# EAGLE board Airband (EAGLE 8.6.3)
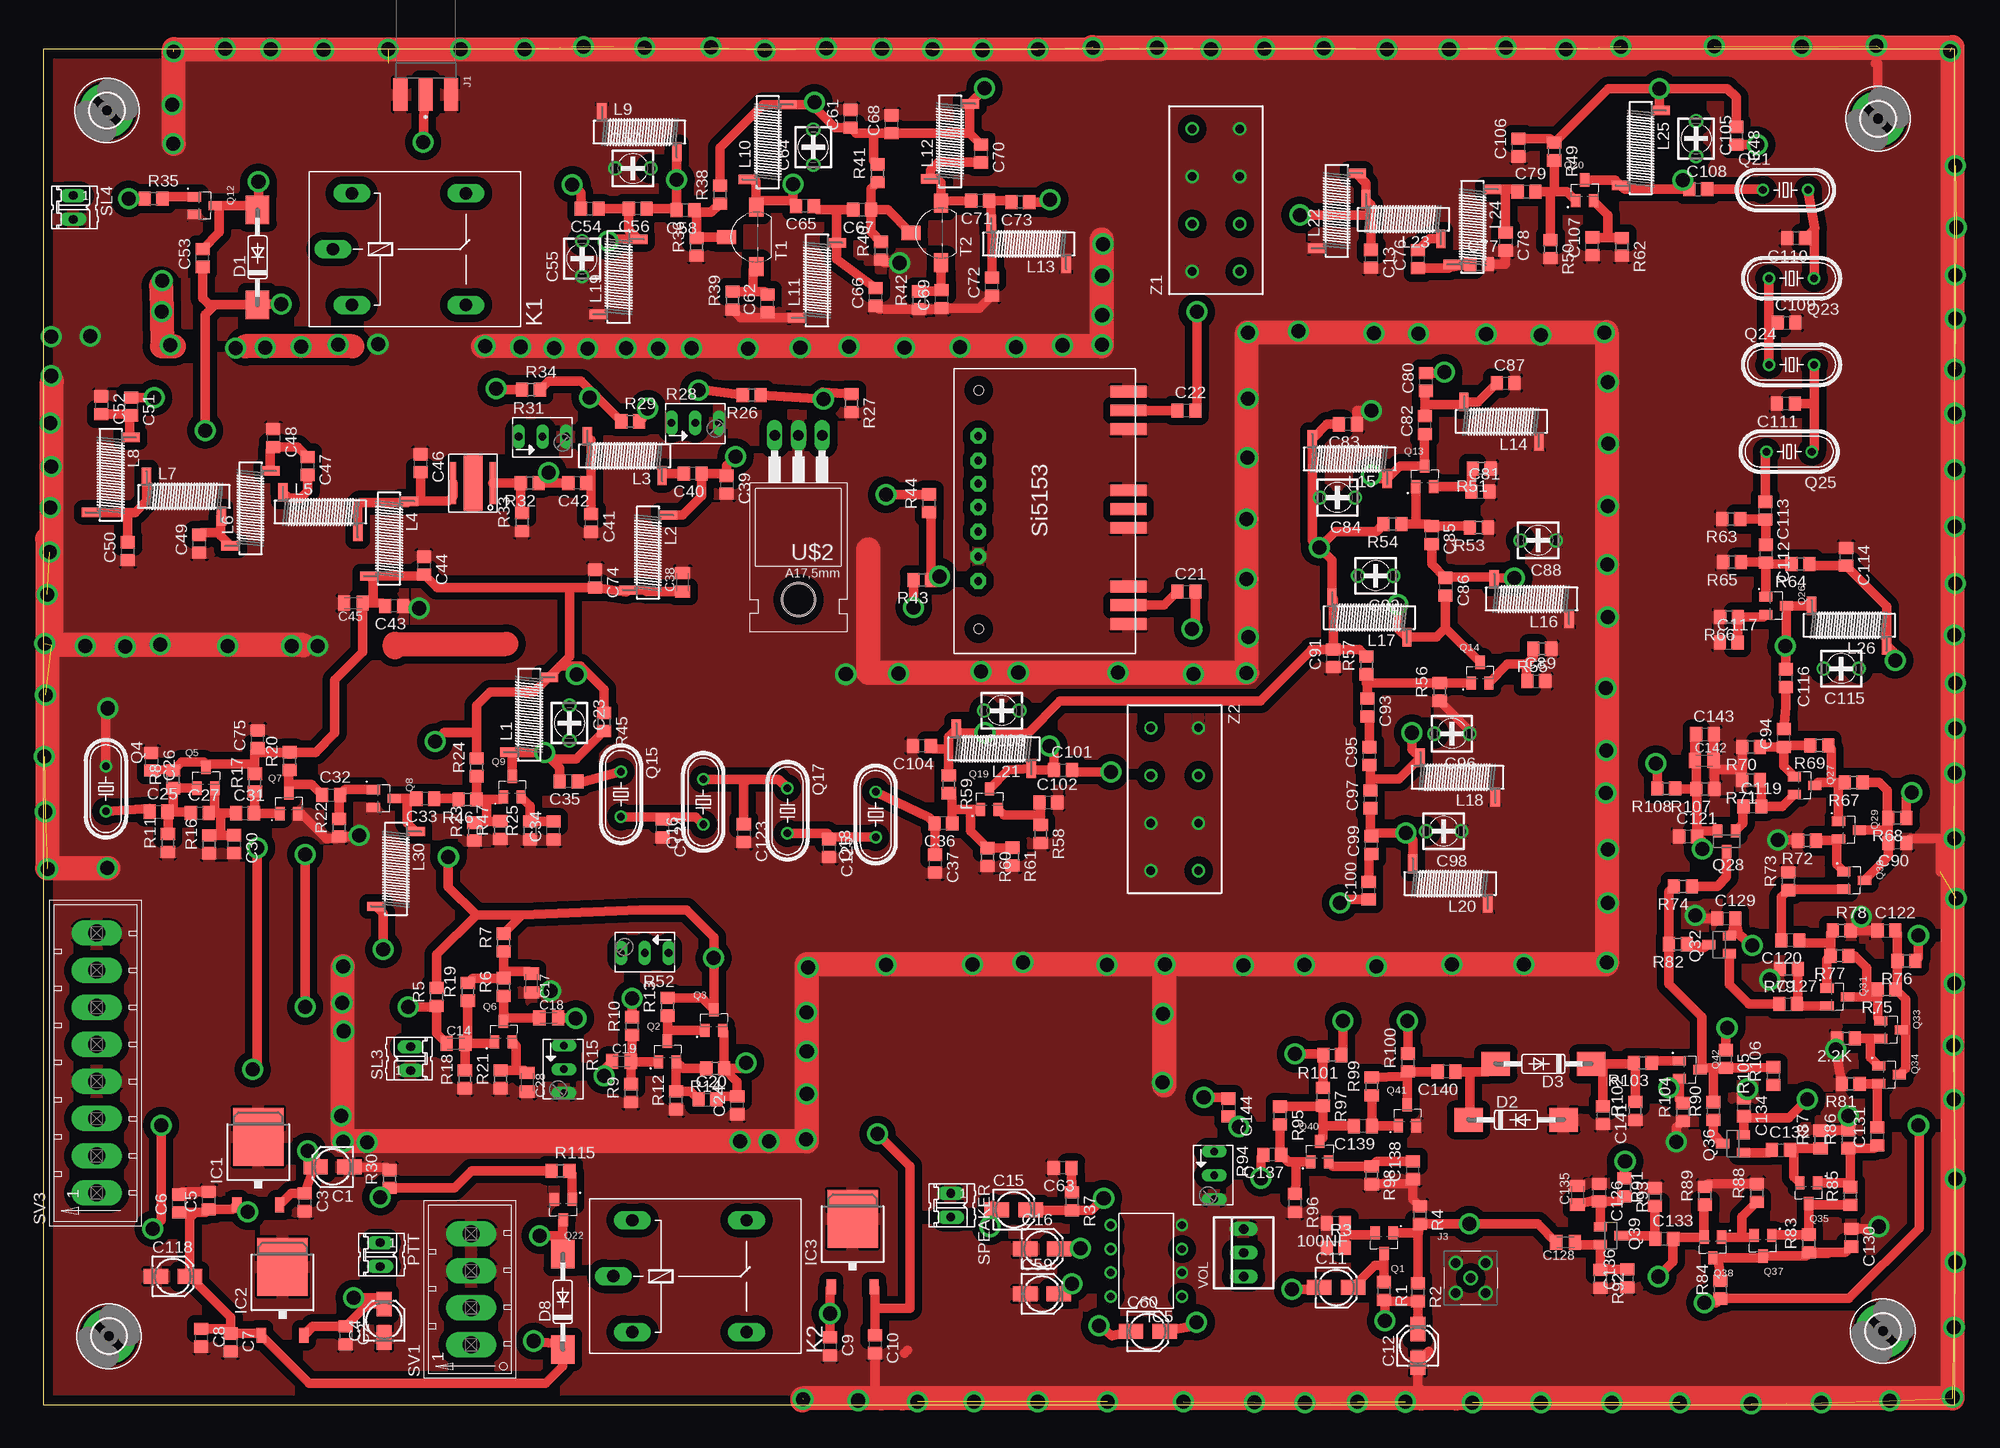
[diagram p7: board, top side]
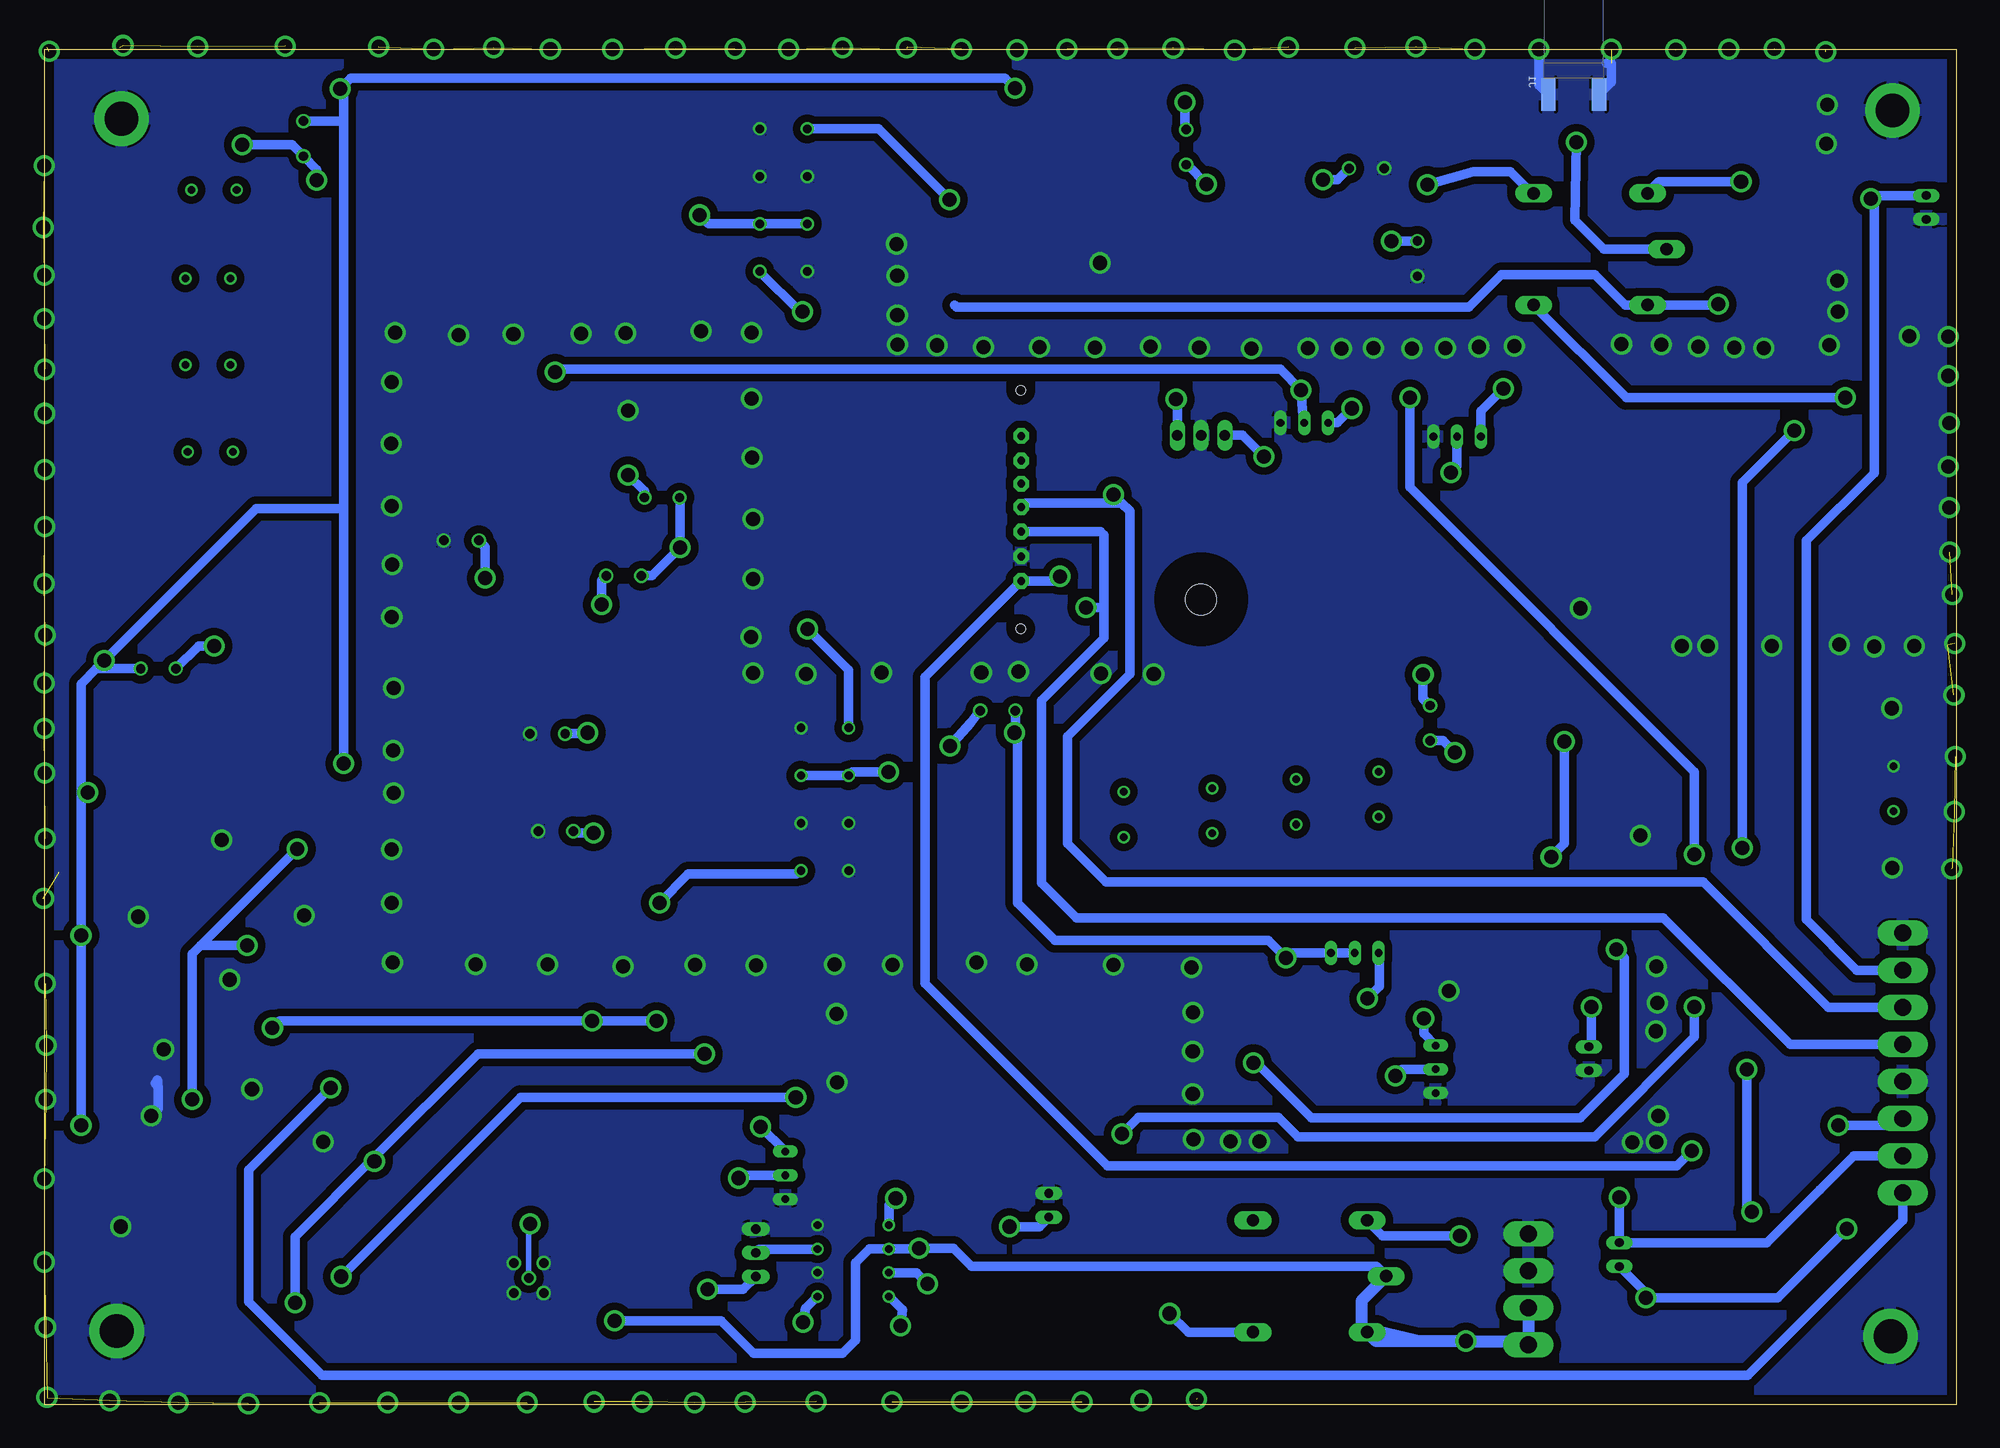
[diagram p8: board, bottom side, seen from below]

Size 204.14 x 144.77 mm. Coordinates in mm from the lower left corner, seen from the top.
Outline: 0,0 204.14,0 204.14,144.77 0,144.77 0,0
Copper layers (1*16): Top 0.035mm / dielectric 1.5mm / Bottom 0.035mm
Design rules "default": minimum track width 6mil, minimum drill 0.35mm, track to track 6mil, track to pad 6mil, pad to pad 6mil, via to via 6mil, smd to smd 6mil, copper to edge 40mil, drill to drill 6mil, minimum pad ring 10mil, minimum via ring 8mil, stop-mask expansion 4mil, vias tented up to drill 0mil, thermal gap 10mil

## Footprints (pad centres in the part's own frame; a part is rotated, then mirrored left to right if it is on the bottom)
R0805 = smd 1.3 x 1.5: 1 -0.95,0; 2 0.95,0
C0805 = smd 1.3 x 1.5: 1 -0.95,0; 2 0.95,0
153CLV-0405 = smd 2.6 x 1.6: + 1.8,0; - -1.8,0
C0805K = smd 1.3 x 1.6: 1 -1,0; 2 1,0
CTRIM3008 = drill 1: + -1.875,0; - 1.875,0
DO35-7SMD = smd 3.048 x 2.54: A 5.08,0; C -5.08,0
3,6-PAD = drill 3.6 pad 5.842: B3,6 0,0
TO252 = smd 1 x 1.6: 1 -2.28,-4.8; 2 2.28,-4.8 | smd 5.4 x 6.2: 3 0,2.5
DIL08 = drill 0.813 pad 1.27: 1 -3.81,-3.81; 2 -1.27,-3.81; 3 1.27,-3.81; 4 3.81,-3.81; 5 3.81,3.81; 6 1.27,3.81; 7 -1.27,3.81; 8 -3.81,3.81
RFSOLUTIONS_CON-SMA-EDGE-S = smd 3.5 x 1.5: 1 0,0; G1 0,2.7; G2 0,-2.7 | smd 3.5 x 1.5 bottom: G3 0,2.7; G4 0,-2.7
CON-SMA-MINI = drill 1: 1 0,0; S1 -1.597,1.597; S2 -1.597,-1.597; S3 1.597,-1.597; S4 1.597,1.597
G5LE = drill 1.321 long: 1 -7.493,-5.969; 2 -7.493,5.969; O 4.699,5.969; P -9.525,0; S 4.699,-5.969
SM-Z15 = smd 1 x 2: 1 -4,2.1; 2 4,-2.1
02P = drill 0.914 long: 1 -1.27,0; 2 1.27,0
SOT95P240X120-3N = smd 1 x 1.4: 1 -0.95,-1.1; 2 0.95,-1.1; 3 0,1.1
HC49/S = drill 0.813: 1 -2.413,0; 2 2.413,0
SOT23 = smd 1 x 1.4: 1 -0.95,-1.1; 2 0.95,-1.1; 3 0,1.1
B64Y = drill 0.813 long: A 2.54,0; E -2.54,0; S 0,0
MT6-4Y = drill 1.803 long: 1 2.54,0; 2 6.502,0; 3 10.465,0; 4 14.427,0
MT6-8 = drill 1.803 long: 1 2.54,0; 2 6.502,0; 3 10.465,0; 4 14.427,0; 5 18.39,0; 6 22.352,0; 7 26.314,0; 8 30.277,0
TO92-EBC(SMD) = smd 1.524 x 2.032: B 0,3.175 | smd 2.032 x 1.524: C 3.175,0; E -3.175,0
RD07MUS2B = smd 4.521 x 0.66: D 0,2.143; G 0,-2.064 | smd 5.842 x 2.032: S 0,0
TO220 = drill 1.118 long: 1 -2.54,-6.35; 2 0,-6.35; 3 2.54,-6.35 | hole 3.302: 0,11.176
DEVELOPMENT-BOARDS$1_SI5153 = drill 0.85 pad 1.676 octagon: 0 -7.683,7.73; 1 -7.683,5.095; 2 -7.683,2.619; GND -7.683,-5.128; SCL -7.683,0.142; SDA -7.683,-2.493; VIN -7.683,-7.763 | smd 3.81 x 1.27: CLK0 8.365,10.46; CLK1 8.365,-0.08; CLK2 8.365,-10.35; GND0 8.365,12.46; GND00 8.365,8.46; GND1 8.365,1.92; GND2 8.365,-8.35; GND11 8.365,-2.08; GND22 8.365,-12.35 | hole 1: -7.635,12.602; -7.635,-12.857
22-23-2031 = drill 1 long: 1 -2.54,0; 2 0,0; 3 2.54,0
A01 = drill 0.9 pad 1.422: 1 -7.62,-2.54; 2 -7.62,2.54; 3 -2.54,-2.54; 4 -2.54,2.54; 5 2.54,-2.54; 6 2.54,2.54; 7 7.62,-2.54; 8 7.62,2.54

## Placement (x,y rotation side)
2.2K  1k  [R0805]  192.54,39.13 180 top
100NF  47n  [C0805]  138.07,19.39 180 top
C1  [153CLV-0405]  30.92,25.38 180 top
C2  [C0805]  32.31,7.4 270 top
C3  [C0805]  27.94,21.61 270 top
C4  [153CLV-0405]  36.41,8.95 90 top
C5  [C0805]  17.7,21.79 90 top
C6  [C0805]  14.53,21.47 90 top
C7  [C0805]  20.02,6.65 270 top
C8  [C0805]  16.89,7.14 270 top
C9  [C0805]  84.04,6.23 270 top
C10  [C0805]  88.84,6.45 270 top
C11  4.7uF  [153CLV-0405]  138.09,12.5 0 top
C12  100uF  [153CLV-0405]  146.8,6.27 90 top
C13  62pF  [C0805]  141.82,122.38 270 top
C14  10uF  [C0805K]  44.09,38.56 0 top
C15  470uF  [153CLV-0405]  103.66,20.82 0 top
C16  220uF  [153CLV-0405]  106.7,16.63 0 top
C17  100uF  [C0805K]  52.17,45.03 270 top
C18  10uF  [C0805K]  53.99,41.31 0 top
C19  10uF  [C0805K]  61.77,36.65 0 top
C20  100pF  [C0805]  70.94,32.58 0 top
C21  20n  [C0805]  122.1,86.82 0 top
C22  20n  [C0805]  122.1,106.18 0 top
C23  10-40pF  [CTRIM3008]  56.2,72.79 270 top
C24  100nF  [C0805]  74.14,31.97 90 top
C25  33pF  [C0805]  12.32,63.32 0 top
C26  10uF  [C0805]  11.57,68.66 270 top
C27  47pF  [C0805]  16.75,63.18 0 top
C28  100uF  [C0805K]  51.71,34.43 270 top
C29  47n  [C0805]  -146.05,218.44 0 top  (outside the outline)
C30  100pF  [C0805]  20.4,59.87 270 top
C31  1nF  [C0805]  21.57,63.16 0 top
C32  1nF  [C0805]  30.76,65.11 0 top
C33  1nF  [C0805]  40.82,64.71 180 top
C34  DNP  [C0805]  54.51,61.32 90 top
C35  22pF  [C0805]  56.12,66.58 180 top
C36  10nF  [C0805]  96.14,62.09 180 top
C37  6.8pF  [C0805]  95.25,57.78 270 top
C38  1uF  [C0805K]  68.3,87.83 90 top
C39  51pF  [C0805]  73.01,98.25 270 top
C40  1n  [C0805]  69.37,99.44 180 top
C41  30pF  [C0805]  58.54,94.16 270 top
C42  1nF  [C0805]  57.05,98.42 180 top
C43  100nF  [C0805]  37.48,85.29 180 top
C44  100uF  [C0805]  40.68,89.59 270 top
C45  1nF  [C0805K]  33.14,85.59 180 top
C46  120pF  [C0805]  40.3,100.55 270 top
C47  1nF  [C0805]  28.24,100.25 270 top
C48  120pF  [C0805]  24.59,103.23 270 top
C49  43pF  [C0805]  16.69,91.96 90 top
C50  43pF  [C0805]  9.05,91.14 90 top
C51  1nF  [C0805]  9.39,106.6 270 top
C52  24pF  [C0805]  6.23,106.74 270 top
C53  47n  [C0805]  17.03,122.46 90 top
C54  10pF  [C0805]  58.38,127.71 180 top
C55  5.30pF  [CTRIM3008]  57.57,122.4 90 top
C56  3.3pF  [C0805]  63.5,127.73 180 top
C57  5.30pF  [CTRIM3008]  62.98,132.04 0 top
C58  10pF  [C0805]  68.6,127.56 180 top
C59  10u  [153CLV-0405]  106.68,11.83 0 top
C60  10u F  [153CLV-0405]  117.97,7.82 0 top
C61  100nF  [C0805]  86.24,137.32 90 top
C62  2.2nF  [C0805]  77.35,117.61 90 top
C63  47nF  [C0805]  108.88,25.28 180 top
C64  5.30pF  [CTRIM3008]  82.25,134.3 90 top
C65  12pF  [C0805]  81.36,128.01 180 top
C66  15pF  [C0805]  88.92,118.29 90 top
C67  1nF  [C0805]  87.47,127.62 180 top
C68  100nF  [C0805]  90.63,136.74 90 top
C69  2.2nF  [C0805]  95.96,118.07 90 top
C70  11pF  [C0805]  100.15,133.63 270 top
C71  12pF  [C0805]  100.07,128.59 180 top
C72  15pF  [C0805]  101.32,119.4 90 top
C73  1nF  [C0805]  104.36,128.43 180 top
C74  1nF  [C0805]  58.96,88.21 270 top
C75  100nF  [C0805]  22.92,71.06 90 top
C76  62pF  [C0805]  146.84,122.34 90 top
C77  68pF  [C0805]  153.35,121.8 0 top
C78  68pF  [C0805]  156.19,124.22 270 top
C79  100nF  [C0805]  158.41,129.56 0 top
C80  1nF  [C0805]  147.7,109.22 90 top
C81  2.2nF  [C0805]  153.49,97.49 0 top
C82  11pF  [C0805]  147.56,104.62 90 top
C83  100nF  [C0805]  139.34,104.7 180 top
C84  5.30pF  [CTRIM3008]  138.23,96.88 180 top
C85  1nF  [C0805]  148.29,92.87 270 top
C86  12pF  [C0805]  149.78,87.35 270 top
C87  11pF  [C0805]  156.19,109.1 0 top
C88  5.30pF  [CTRIM3008]  159.66,92.29 180 top
C89  2.2nF  [C0805]  159.46,77.27 0 top
C90  100nF  [C0805]  198.02,59.99 180 top
C91  100nF  [C0805]  137.78,79.71 90 top
C92  5.30pF  [CTRIM3008]  142.32,88.52 180 top
C93  1nF  [C0805]  141.45,74.45 270 top
C94  10nF  [C0805]  185.9,71.2 90 top
C95  10pF  [C0805]  141.64,69.25 90 top
C96  5.30pF  [CTRIM3008]  150.46,71.66 180 top
C97  10pF  [C0805]  141.74,64.65 90 top
C98  5.30pF  [CTRIM3008]  149.58,61.24 180 top
C99  10pF  [C0805]  141.86,59.75 90 top
C100  1nF  [C0805]  141.57,54.89 90 top
C101  100nF  [C0805]  108.92,67.79 0 top
C102  DNP  [C0805]  107.35,64.33 0 top
C103  10-40pF  [CTRIM3008]  102.37,74.12 180 top
C104  100nF  [C0805]  93.84,70.35 180 top
C105  10-40pF  [CTRIM3008]  176.53,135.22 270 top
C106  100nF  [C0805]  157.56,134.26 90 top
C107  10nF  [C0805]  165.44,123.71 90 top
C108  22nF  [C0805]  176.75,129.8 0 top
C109  10pF  [C0805]  186.19,115.55 0 top
C110  18pF  [C0805]  187.23,124.56 180 top
C111  18pF  [C0805]  186.11,106.9 180 top
C112  10nF  [C0805]  183.97,90.88 270 top
C113  27pF  [C0805]  183.91,95.47 270 top
C114  100nF  [C0805]  192.54,90.55 270 top
C115  10-40pF  [CTRIM3008]  192.03,78.6 180 top
C116  10nF  [C0805]  186.11,77.59 270 top
C117  DNP  [C0805]  180,81.38 0 top
C118  [153CLV-0405]  13.87,13.69 0 top
C119  10nF  [C0805]  182.54,63.9 0 top
C120  10nF  [C0805]  186.59,49.59 180 top
C121  10nF  [C0805]  175.66,60.7 0 top
C122  100nF  [C0805]  196.85,50.62 0 top
C123  10pF  [C0805]  74.83,61.04 270 top
C124  18pF  [C0805]  66.14,61.54 270 top
C125  18pF  [C0805]  83.94,59.43 270 top
C126  100nF  [C0805]  166.17,22.64 270 top
C127  10nF  [C0805]  186.35,42.78 0 top
C128  10uF  [C0805K]  162.58,17.34 180 top
C129  10nF  [C0805]  179.76,51.93 0 top
C130  100nF  [C0805]  193.1,17.82 270 top
C131  10nF  [C0805]  195.9,28.65 90 top
C132  10nF  [C0805]  185.58,27.19 0 top
C133  10nF  [C0805]  173.12,17.72 0 top
C134  10nF  [C0805]  181.61,31.77 270 top
C135  10uF  [C0805K]  163.87,22.36 90 top
C136  10nF  [C0805]  169.19,13.49 90 top
C137  10nF  [C0805]  131.27,26.69 180 top
C138  10nF  [C0805]  146.29,25.04 90 top
C139  10nF  [C0805]  140.95,29.75 180 top
C140  1nF  [C0805]  149.88,35.56 180 top
C141  1uF  [C0805]  166.59,30.92 270 top
C142  10uF  [C0805K]  177.4,68.78 0 top
C143  100nF  [C0805]  177.48,71.6 0 top
C144  10nF  [C0805]  126.6,31.73 270 top
D1  1N4148DO35-10  [DO35-7SMD]  22.9,122.54 90 top
D2  1N4148DO35-10  [DO35-7SMD]  157.3,30.42 0 top
D3  1N4148DO35-10  [DO35-7SMD]  160.22,36.39 180 top
D8  1N4148DO35-10  [DO35-7SMD]  55.5,10.97 90 top
H1  MOUNT-PAD-ROUND3.6  [3,6-PAD]  6.81,138.23 0 top
H2  MOUNT-PAD-ROUND3.6  [3,6-PAD]  195.96,137.34 0 top
H3  MOUNT-PAD-ROUND3.6  [3,6-PAD]  7.04,7.3 0 top
H4  MOUNT-PAD-ROUND3.6  [3,6-PAD]  196.47,7.86 0 top
IC1  7808DT  [TO252]  22.98,26.11 0 top
IC2  7808DT  [TO252]  25.58,12.2 0 top
IC3  7808DT  [TO252]  86.46,17.36 0 top
IC5  LM386N-1  [DIL08]  117.81,15.36 90 top
J1  CON-SMA-EDGE-S  [RFSOLUTIONS_CON-SMA-EDGE-S]  40.86,139.92 270 top
J3  CON-SMA  [CON-SMA-MINI]  152.46,13.51 0 top
K1  G5L  [G5LE]  40.46,123.41 0 top
K2  G5L  [G5LE]  70.43,13.71 0 top
L1  1uH  [SM-Z15]  51.91,73.68 90 top
L2  100uH  [SM-Z15]  64.59,91 270 top
L3  100uH  [SM-Z15]  62.11,101.32 180 top
L4  100uH  [SM-Z15]  36.95,92.49 270 top
L5  100uH  [SM-Z15]  29.61,95.33 0 top
L6  100uH  [SM-Z15]  22.15,95.73 90 top
L7  100uH  [SM-Z15]  15.04,97 0 top
L8  100uH  [SM-Z15]  7.22,99.3 270 top
L9  100uH  [SM-Z15]  63.68,135.91 0 top
L10  100uH  [SM-Z15]  77.39,134.84 90 top
L11  100uH  [SM-Z15]  82.65,120.07 90 top
L12  100uH  [SM-Z15]  96.86,134.92 90 top
L13  100uH  [SM-Z15]  105.25,123.96 180 top
L14  100uH  [SM-Z15]  155.73,104.99 180 top
L15  100uH  [SM-Z15]  139.54,101 180 top
L16  100uH  [SM-Z15]  158.97,86.04 180 top
L17  100uH  [SM-Z15]  141.64,84.06 180 top
L18  100uH  [SM-Z15]  151.07,66.99 180 top
L19  100uH  [SM-Z15]  61.46,120.45 90 top
L20  100uH  [SM-Z15]  150.28,55.64 180 top
L21  100uH  [SM-Z15]  101.54,70.05 180 top
L22  100uH  [SM-Z15]  138.15,127.5 90 top
L23  100uH  [SM-Z15]  145.28,126.6 180 top
L24  100uH  [SM-Z15]  152.66,125.79 270 top
L25  100uH  [SM-Z15]  170.62,134.2 270 top
L26  100uH  [SM-Z15]  192.88,83.22 180 top
L30  100uH  [SM-Z15]  37.68,57.21 270 top
PTT  [02P]  36,16.01 270 top
Q1  MMBT3904  [SOT95P240X120-3N]  143.21,17.26 180 top
Q2  MMBT3904  [SOT95P240X120-3N]  66.67,37.72 0 top
Q3  MMBT3904  [SOT95P240X120-3N]  71.64,41.06 0 top
Q4  32MHZ  [HC49/S]  6.71,65.78 270 top
Q5  MMBT3904  [SOT95P240X120-3N]  17.38,66.93 0 top
Q6  MMBT3904  [SOT95P240X120-3N]  49.17,39.83 0 top
Q7  MMBT3904  [SOT95P240X120-3N]  26.23,64.21 0 top
Q8  MMBT3904  [SOT95P240X120-3N]  36.37,64.73 270 top
Q9  MMBT3904  [SOT95P240X120-3N]  50.11,65.98 0 top
Q12  MMBT3904  [SOT95P240X120-3N]  17.26,128.05 270 top
Q13  MMBT3904  [SOT95P240X120-3N]  147.54,99.14 0 top
Q14  MMBT3904  [SOT95P240X120-3N]  153.45,78.18 0 top
Q15  32MHz  [HC49/S]  61.71,65.19 270 top
Q16  32MHz  [HC49/S]  70.5,64.37 90 top
Q17  32MHz  [HC49/S]  79.49,63.42 270 top
Q18  32MHz  [HC49/S]  88.92,63.02 90 top
Q19  MMBT3904  [SOT95P240X120-3N]  101.06,64.67 0 top
Q20  MMBT3904  [SOT95P240X120-3N]  164.62,129.7 0 top
Q21  32MHz  [HC49/S]  186.07,129.72 0 top
Q22  MMBT3904  [SOT95P240X120-3N]  55.56,20.82 180 top
Q23  32MHz  [HC49/S]  186.73,120.29 180 top
Q24  32MHz  [HC49/S]  186.73,111.07 0 top
Q25  32MHz  [HC49/S]  186.47,101.78 180 top
Q26  MMBT3904  [SOT95P240X120-3N]  185.06,85.31 270 top
Q27  MMBT3904  [SOT95P240X120-3N]  188.12,66.12 270 top
Q28  MMBFJ3  [SOT23]  179.78,60.19 180 top
Q29  MMBT3904  [SOT95P240X120-3N]  192.84,61.36 270 top
Q30  MMBT3904  [SOT95P240X120-3N]  193.42,55.98 270 top
Q31  MMBT3904  [SOT95P240X120-3N]  191.61,43.54 270 top
Q32  MMBFJ3  [SOT23]  178.97,49.11 90 top
Q33  MMBT3904  [SOT95P240X120-3N]  197.35,40.02 270 top
Q34  MMBT3904  [SOT95P240X120-3N]  197.15,35.22 270 top
Q35  MMBT3904  [SOT95P240X120-3N]  188.56,22.6 180 top
Q36  MMBFJ3  [SOT23]  180.46,27.86 90 top
Q37  MMBT3904  [SOT95P240X120-3N]  183.67,16.97 180 top
Q38  MMBT3904  [SOT95P240X120-3N]  178.32,16.79 180 top
Q39  MMBFJ3  [SOT23]  167.42,18.04 270 top
Q40  MMBT3904  [SOT95P240X120-3N]  136.33,27.03 0 top
Q41  MMBT3904  [SOT95P240X120-3N]  145.69,30.9 0 top
Q42  MMBT3904  [SOT95P240X120-3N]  175.86,35.76 270 top
R1  620R  [R0805]  143.17,12.14 270 top
R2  27k  [R0805]  146.8,12.01 270 top
R3  100R  [R0805]  138.05,16.75 0 top
R4  3.3k  [R0805]  147.02,20.24 270 top
R5  4.7k  [R0805]  42.03,43.54 90 top
R6  4.7k  [R0805]  49.17,44.59 90 top
R7  1k  [R0805]  49.17,49.35 90 top
R8  47k  [R0805]  13.91,66.77 90 top
R9  10k  [R0805]  62.79,33.28 90 top
R10  39k  [R0805]  62.9,40.42 90 top
R11  12k  [R0805]  13.34,59.99 90 top
R12  1k  [R0805]  67.61,32.5 90 top
R13  4.7k  [R0805]  66.67,42.49 90 top
R14  47k  [R0805]  71.77,35.9 180 top
R15  10K  [B64Y]  55.62,35.82 270 top
R16  1k  [R0805]  17.74,59.85 90 top
R17  100k  [R0805]  22.62,66.44 90 top
R18  10k  [R0805]  45.05,34.75 90 top
R19  47k  [R0805]  45.36,44.09 90 top
R20  1.2k  [R0805]  26.33,68.72 90 top
R21  1k  [R0805]  48.86,34.75 90 top
R22  470R  [R0805]  31.61,61.61 90 top
R23  100R  [R0805]  46.06,61.2 90 top
R24  8.2k  [R0805]  46.32,68.06 90 top
R25  150R  [R0805]  52.01,61.32 90 top
R26  3.3R  [R0805]  75.68,107.83 180 top
R27  10k  [R0805]  86.34,106.96 270 top
R28  10K  [B64Y]  69.65,104.87 0 top
R29  10k  [R0805]  62.71,105.01 0 top
R30  10  [R0805]  36.99,24.09 90 top
R31  10K  [B64Y]  53.32,103.39 0 top
R32  5.1R  [R0805]  51.97,98.42 180 top
R33  10k  [R0805]  51.14,94.26 90 top
R34  10k  [R0805]  52.11,108.39 0 top
R35  1k  [R0805]  11.79,128.79 0 top
R36  2.2k  [R0805]  69.77,123.65 90 top
R37  10R  [R0805]  109.87,21.71 270 top
R38  8.2k  [R0805]  72.29,129.22 90 top
R39  220R  [R0805]  73.62,117.91 90 top
R40  1.2k  [R0805]  89.5,123.23 90 top
R41  4.7k  [R0805]  89.1,131.5 90 top
R42  82R  [R0805]  93.56,117.95 90 top
R43  10k  [R0805]  93.9,88.07 180 top
R44  1k  [R0805]  94.61,96.26 90 top
R45  240R  [R0805]  59.91,72.91 270 top
R46  680R  [R0805]  45.32,64.61 180 top
R47  2.2k  [R0805]  48.84,61.36 90 top
R48  240R  [R0805]  180.82,135.51 270 top
R49  4.7k  [R0805]  161.37,133.83 270 top
R50  1k  [R0805]  160.97,123.41 270 top
R51  82R  [R0805]  153.63,99.99 180 top
R52  22k  [B64Y]  64.25,48.24 180 top
R53  1.2k  [R0805]  153.33,93.66 180 top
R54  4.7k  [R0805]  144.11,94.04 180 top
R55  82R  [R0805]  160.1,80.72 180 top
R56  1.2k  [R0805]  149.15,76.12 90 top
R57  4.7k  [R0805]  141.35,78.96 90 top
R58  150R  [R0805]  106.54,60.94 270 top
R59  8.2k  [R0805]  96.72,66.24 270 top
R60  2.2k  [R0805]  100.85,58.48 270 top
R61  680R  [R0805]  103.52,58.52 270 top
R62  75R  [R0805]  168.61,123.65 270 top
R63  300R  [R0805]  180.28,94.6 180 top
R64  8.2k  [R0805]  187.68,89.79 180 top
R65  2.2k  [R0805]  180.36,89.97 180 top
R66  150R  [R0805]  180.04,84.12 180 top
R67  220R  [R0805]  193.36,66.44 180 top
R68  10R  [R0805]  198.02,62.67 180 top
R69  2.2k  [R0805]  189.69,70.41 180 top
R70  1k  [R0805]  182.4,70.25 180 top
R71  100R  [R0805]  182.38,66.69 180 top
R72  2.2k  [R0805]  188.38,60.23 180 top
R73  470R  [R0805]  186.39,55.9 90 top
R74  100k  [R0805]  175.12,55.34 180 top
R75  220R  [R0805]  196.89,44.33 180 top
R76  10R  [R0805]  198.99,47.39 180 top
R77  2.2k  [R0805]  191.85,47.94 180 top
R78  1k  [R0805]  192.07,50.64 0 top
R79  1k  [R0805]  186.43,46.53 180 top
R81  470R  [R0805]  193.04,34.27 180 top
R82  100K  [R0805]  174.59,49.17 180 top
R83  220R  [R0805]  188.56,17.2 90 top
R84  10R  [R0805]  179.11,12.28 90 top
R85  2.2k  [R0805]  193,22.28 90 top
R86  1k  [R0805]  192.78,28.34 90 top
R87  100R  [R0805]  189.83,28.32 90 top
R88  2.2k  [R0805]  183,22.6 90 top
R89  470R  [R0805]  177.48,22.3 90 top
R90  100k  [R0805]  178.38,31.35 90 top
R91  1k  [R0805]  172.14,22.17 90 top
R92  1k  [R0805]  166.29,13.43 270 top
R93  100R  [R0805]  168.89,23.2 270 top
R94  22k  [B64Y]  125.06,24.49 270 top
R95  22k  [R0805]  132.1,30.88 270 top
R96  4.7k  [R0805]  133.69,21.55 270 top
R97  1k  [R0805]  136.68,32.88 270 top
R98  100R  [R0805]  141.88,24.51 270 top
R99  220k  [R0805]  141.88,33.99 90 top
R100  2.2k  [R0805]  145.77,36.53 90 top
R101  100R  [R0805]  137.68,37.33 180 top
R102  1M  [R0805]  170.02,31.37 90 top
R103  3.3k  [R0805]  170.83,36.51 180 top
R104  1k  [R0805]  175.1,31.25 90 top
R105  3.3k  [R0805]  179.69,36.91 270 top
R106  10k  [R0805]  184.77,35.08 90 top
R107  1k  [R0805]  177.5,65.76 180 top
R108  3.9k  [R0805]  173.34,65.78 180 top
R115  1k  [R0805]  55.24,24.98 0 top
SL3  [02P]  39.25,36.95 90 top
SL4  [02P]  3.21,127.87 270 top
SPEAKER  [02P]  96.92,21.29 270 top
SV1  [MT6-4Y]  45.72,3.83 90 top
SV3  [MT6-8]  5.73,20.08 90 top
T1  2N3904  [TO92-EBC(SMD)]  76.16,124.7 90 top
T2  2N3904  [TO92-EBC(SMD)]  95.89,125.13 90 top
U$1  RD04HMS2  [RD07MUS2B]  45.94,98.42 90 top
U$2  MRF101AN  [TO220]  80.66,97.17 180 top
U$10  [DEVELOPMENT-BOARDS$1_SI5153]  107.55,95.73 0 top
VOL  22-23-2031  [22-23-2031]  128.21,16.21 90 top
Z1  SRA-1  [A01]  125.25,128.65 90 top
Z2  SRA-1  [A01]  120.85,64.65 270 top

## Tracks (layer width: path | path; a pad name or v marks a point on that pad's centre or on a via)
+5VA  (via drill 1.5)
  Top 1.016: IC1.2 26.5,22.56 C3.1 29.15,26.03 C1.+ 28.83,27.07 v28.28,27.09 | R44.1 94.85,95.08 R43.1 95.25,88.46 v95.73,88.46
  Bottom 1.016: v95.73,88.46 96.23,87.96 U$10.VIN 110.13,77.7 110.13,45.01 90.65,25.52 29.84,25.52 v28.28,27.09
+5VB  (via drill 1.5)
  Top 1.016: IC2.2 28.81,8.35 C2.1 34.7,10.75 C4.+ 35.75,11.41 v33.18,11.41 | v11.73,18.77 12.62,19.66 v12.62,29.84
  Bottom 1.016: PTT.2 33.18,11.93 v33.18,11.41 19.09,11.41 v11.73,18.77 | v12.62,29.84 6.15,29.84 5.42,30.58 | 5.22,30.78 5.42,30.58 | SV3.3 6.32,30.55 6.35,30.58 5.42,30.58
+12V  (via drill 1.5)
  Top 1.016: C12.+ 146.84,11.02 R2.2 143.31,11.05 | 143.31,11.05 R1.2 | v110.77,16.69 108.56,16.69 C16.+ | C53.1 17.03,118.19 17.76,117.45 18.36,117.45 | v25.44,117.53 22.98,117.53 D1.C 18.36,117.45 | v52.39,6.79 54.49,6.55 D8.C 55.5,4.11 53.66,2.26 28.44,2.26 IC2.1 23.11,7.6 C7.1 | v143.29,8.93 143.29,11.04 143.31,11.05 | C6.1 16.31,20.52 | 16.31,20.52 17.38,20.52 C5.1 20.22,20.84 IC1.1 21.43,20.58 v21.87,20.58 | C8.1 19.53,8.09 C7.1 | C7.1 20.02,9.34 C118.+ 15.67,19.88 16.31,20.52 | 18.36,117.45 17.3,116.4 v17.3,104.04 | v22.86,59.45 22.86,36.27 v22.38,35.8
  Bottom 1.016: v25.44,117.53 25.54,117.44 K1.1 35.37,117.44 38.6,120.67 48.62,120.67 52.09,117.2 106.76,117.2 107,117.44 | K2.1 63.54,8.35 56.97,6.83 v52.39,6.79 | K2.P 61.95,14.76 105.17,14.76 107.1,16.69 v110.77,16.69 110.83,16.63 IC5.6 116.07,16.63 117.55,15.14 117.55,6.87 118.94,5.48 128.47,5.48 131.92,8.93 v143.29,8.93 | 46.14,6.79 SV1.1 | v17.3,104.04 22.86,98.48 v22.86,59.45 | v21.87,20.58 22.38,21.09 v22.38,35.8
  Bottom 1.27: K2.P 63.54,11.07 63.54,8.35 | K2.1 61.98,6.79 v52.39,6.79 46.14,6.79 | SV1.2 SV1.1
+12V-RX  (via drill 1.5)
  Top 1.016: 88.68,135.79 C68.1 98.94,135.79 C70.1 98.96,135.77 L12.2 100.53,140.49 v100.53,140.59 | 88.68,135.79 86.82,135.79 C61.1 84.58,136.37 82.11,138.84 | R41.2 88.68,132.87 88.68,135.79 | 82.11,138.84 L10.2 76.91,138.84 72.29,134.22 R38.2 | 82.11,138.84 v82.37,139.1 | R64.1 188.83,89.6 C114.2 196.88,85.26 L26.1 197.78,80.22 v197.78,79.47 | v133.71,37.44 136.61,37.44 136.68,37.37 | 136.68,37.37 R101.2 | R97.1 136.68,37.37 | R93.1 168.89,25.92 v168.95,25.97 | R108.2 172.38,68.32 v172.22,68.48 | v172.6,140.55 172.6,138.32 L25.1 | R48.1 180.82,139.62 179.88,140.55 v172.6,140.55 | C106.2 160.93,135.21 R49.1 167.15,140.55 v172.6,140.55 | v200.28,50.12 200.28,47.73 R76.1 | R68.1 198.97,64.79 v199.57,65.38 | v200.28,29.8 200.38,29.71 200.38,18.85 192.86,11.33 R84.1 178.67,10.89 v177.4,10.89
  Bottom 1.016: v82.37,139.1 82.37,136.3 C64.- | v133.71,37.44 157.9,37.44 168.95,26.39 | 172.22,137.04 172.22,140.18 v172.6,140.55 171.47,141.68 101.62,141.68 v100.53,140.59 | C105.+ 172.27,137.09 172.22,137.04 | 198.65,78.61 v197.78,79.47 181.57,95.69 172.22,95.69 | 198.65,78.61 200.28,76.97 200.28,65.98 | 200.28,65.98 v200.28,50.12 v200.28,29.8 | v199.57,65.38 200.16,65.98 200.28,65.98 | 172.22,137.04 172.22,95.69 | 172.22,95.69 v172.22,68.48 | C115.+ 198.64,78.6 198.65,78.61 | 168.95,26.39 v168.95,25.97 | v177.4,10.89 177.4,17.94 168.95,26.39
+12V-TX  (via drill 1.5)
  Top 1.016: C83.2 137.13,104.7 L15.2 135.54,92.28 v136.29,91.54 | R54.2 142.38,93.27 138.01,93.27 v136.29,91.54 | v136.29,91.54 137.65,90.18 L17.2 137.78,86.03 C91.2 | R13.2 70.36,43.43 Q3.3 71.64,47.64 | 71.64,47.64 v71.6,47.68 | C38.1 64.47,86.83 64.32,86.98 L2.2 62.27,86.78 C74.2 56.22,87.25 | 35.26,85.59 C45.1 34.14,80.39 31.14,77.39 31.14,71.72 29.09,69.67 R20.2 22.77,69.67 22.62,69.81 | 35.26,85.59 36.24,85.59 C43.2 | 35.26,85.59 35.26,88.08 L4.2 39.98,88.49 C44.2 42.07,87.25 56.22,87.25 | C26.2 13.75,67.88 R8.2 14.81,68.62 17.12,68.62 17.38,68.36 Q5.3 17.79,68.44 22.62,68.44 | R17.2 22.62,68.44 | 22.62,68.44 22.62,69.81 | 22.62,69.81 C75.1 | 96.72,70.05 96.72,71.33 L21.2 97.87,71.82 97.87,71.72 100.57,71.72 | 96.72,70.05 R59.1 | C104.1 95.09,70.05 96.72,70.05 | R57.2 140.59,80.66 C91.2 | R7.2 51.18,52.31 | 71.64,47.64 71.64,49.91 68.7,52.84 63.74,52.84 51.18,52.31 | R24.2 46.31,71.8 | 46.31,71.8 46.31,74.67 47.74,76.1 52.43,76.1 L1.2 55.22,78.89 | R5.2 42.03,48.06 46.28,52.31 | 46.28,52.31 51.18,52.31 | v100.61,71.75 100.57,71.72 | 100.57,71.72 105.21,71.72 108.62,75.13 130,75.13 135.45,80.58 135.45,80.62 135.49,80.66 C91.2 | 55.22,78.89 56.22,79.89 56.22,87.25 | R45.1 59.91,76.36 57.38,78.89 56.81,78.89 | 56.81,78.89 55.22,78.89 | v56.95,77.99 56.95,78.75 56.81,78.89 | 46.31,71.8 42.84,71.8 v41.87,70.82 | v43.28,58.5 43.28,55.3 46.28,52.31
  Bottom 1.016: C92.- 139.3,88.52 v136.29,91.54 136.29,96.81 C84.- | C103.- 100.5,71.86 | 100.5,71.86 v100.61,71.75 | 100.5,71.86 100.25,71.62 100.25,53.56 96.24,49.55 73.46,49.55 v71.6,47.68 71.04,48.24 R52.E R52.S | C23.+ 56.95,75.42 v56.95,77.99 | v41.87,70.82 41.87,59.91 v43.28,58.5
+12V_TX  (via drill 1.5)
  Top 1.016: IC3.1 84.02,12.4 v84.02,9.72 84.02,7.2 C9.1
  Bottom 1.016: K2.S 82.04,7.74 v84.02,9.72
AF-OUT  (via drill 1.5)
  Top 1.016: R2.1 146.8,18.12 R4.2 | Q1.1 146.56,18.36 R4.2 | R4.2 v152.3,19.29 159.63,19.29 C128.2
  Bottom 0.61: J3.1 152.46,19.13 v152.3,19.29
ANT  (via drill 1.5)
  Top 1.016: v40.58,134.84 40.74,140.87 J1.1
  Bottom 1.016: K1.P 37.64,123.41 40.74,126.5 v40.58,134.84
ANT-SWT  (via drill 1.5)
  Top 1.016: R35.1 v9.15,128.79
  Bottom 1.016: v9.15,128.79 8.79,129.14 | 8.79,129.14 SL4.1 | SV3.7 10.64,46.4 16.03,51.79 16.03,92.27 8.79,99.52 8.79,129.14
BIAS  (via drill 1.5)
  Top 1.016: R34.2 53.99,109.32 57.45,109.32 59.04,107.73 | R29.1 59.04,107.73 | IC3.2 88.84,12.46 88.84,10.2 | 88.84,10.2 C10.1 | 59.04,107.73 58.54,107.73 v58.36,107.55 | 88.84,10.2 88.9,10.26 92.57,10.26 92.57,25.46 v89.12,28.91 | v27.98,58.76 v27.98,42.47
  Bottom 1.016: v27.98,58.76 27.98,67.59 58.36,97.97 v58.36,107.55 | v89.12,28.91 87.35,30.68 72.41,30.68 70.33,28.59 38.64,28.59 27.98,39.25 v27.98,42.47
GND  (via drill 1.5)  (70 unrouted)
  Top 1.016: R89.2 177.78,23.55 R88.2 | R87.2 189.84,29.29 R86.2 v192.78,30.82 | R81.2 v191.43,37.95 191.59,38.11 2.2K.2 | R104.1 174.41,29.61 v174.41,28.06 | C134.1 181.61,33.28 v182.03,33.69 | R98.2 145.75,23.56 C138.1 146.29,21.92 R4.1 | R79.2 184.39,45.44 v184.39,45.38 | C122.1 195.88,50.64 R78.2 194.19,51.81 v194.19,52.11 | R107.1 178.45,68.14 | 178.45,68.14 178.45,68.73 178.43,68.75 | 178.43,68.75 C142.2 | C143.2 178.43,68.75 | R70.2 181.45,67.83 | 181.45,67.83 181.45,66.71 R71.2 | 181.45,67.83 178.77,67.83 178.45,68.14 | Q4.1 6.71,74.18 v6.91,74.37 | C66.1 89.26,117 R42.1 95.84,117 C69.1 99.99,117.12 C72.1 | R40.1 89.83,121.94 v91.46,121.94 | C130.1 195.8,18.77 v196.04,19.01 | C5.2 14.84,22.74 C6.2 | v33.73,60.8 33.6,60.66 R22.1 31.41,60.46 30.22,60.46 27.57,63.11 Q7.2 | R30.2 36.67,25.36 32.74,25.36 C1.- | R56.1 152.45,71.86 152.54,71.86 C96.+ | R39.1 74.51,116.07 77.31,116.07 | 77.31,116.07 L11.1 | C62.1 77.31,116.62 77.31,116.07 | C17.2 54.07,44.02 v54.21,44.17 | C43.1 39.93,85.29 v40.16,85.05 | C129.1 177.07,51.93 176.79,52.21 176.47,52.21 v176.45,52.23 | R72.2 187.37,60.28 v185.28,60.28 | C83.1 140.29,106.18 v141.84,106.18 | C78.2 156.19,121.8 C77.2 | 92.02,5.5 92.31,5.79 | 148.01,5.67 C12.- 146.8,1.88 147.16,1.52 | C10.2 88.84,1.82 89.14,1.52 | v87.06,0.44 87.27,0.66 89.5,0.66 | v93.39,0.32 92.08,0.32 91.74,0.66 | v152.64,0.22 150.99,0.22 150.93,0.16 | 150.85,0.08 150.93,0.16 | 150.93,0.16 150.93,0.66 | v145.49,0.28 145.87,0.66 147.16,0.66 | C90.1 199.45,60.46 202.62,60.46 | 202.62,56.89 202.62,60.46 | v204.11,60.46 202.62,60.46 | H2.B3,6 195.96,143.25 195.66,143.25 | 196.39,144.98 196.33,144.92 196.14,144.92
  Top 2.54: 88.11,91.34 88.11,78.16 128.59,78.16 128.59,114.52 166.99,114.52 | 166.99,114.52 166.99,114.6 | 166.99,114.52 166.99,47.03 81.56,47.03 81.56,28.1 32.01,28.1 32.01,46.85 | 27.8,81.1 0.93,81.1 0.93,109.26 | 0.44,92.47 0.44,57.31 7,57.31 | 113.03,124.46 113.03,113.03 46.99,113.03 | 13.97,134.62 13.97,144.78 113.03,144.78 | 112.04,144.92 196.14,144.92 203.9,144.92 203.9,0.66 150.93,0.66 147.16,0.66 91.74,0.66 89.5,0.66 81.08,0.66 81.08,0.44 | 112.04,144.98 196.39,144.98 203.9,144.98 | 119.46,46.89 119.72,46.89 119.72,34.05
  Bottom 1.016: 192.78,30.94 192.7,30.94 192.7,30.7 192.72,30.68 192.78,30.74 v192.78,30.82 192.03,31.57 192.03,33.99 192.07,34.03 192.07,34.53 192.17,34.63 | 192.17,34.63 192.17,34.67 | 192.17,34.63 192.17,34.01 192.11,33.95 192.07,33.99 192.07,34.59 | 192.07,34.63 192.07,34.59 | 192.07,34.59 192.34,34.31 | 37.41,143.25 36.83,143.25 36.83,141.25 J1.G2 | v44.57,144.74 44.57,140.93 J1.G1
  other vias: 47.23,113.03 51.02,112.97 54.57,112.83 58.14,112.79 62.27,112.85 65.68,112.77 69.27,112.85 113.11,116.36 113.11,120.57 113.17,123.96 75.31,112.79 80.86,112.89 86.06,113.01 92,112.89 97.91,112.93 103.92,112.93 108.86,113.13 113.07,113.19 128.69,114.48 134.04,114.66 128.69,107.43 128.63,101.16 142.12,114.44 146.88,114.38 154.11,114.34 159.94,114.22 166.73,114.5 167.12,109.2 167.18,102.65 167.1,95.96 167.04,89.73 167.08,84.14 166.89,76.54 166.95,69.85 128.53,94.6 128.53,88.17 128.71,81.97 128.53,78.12 122.85,78.05 114.8,78.2 104.14,78.2 100.15,78.28 91.34,78.09 166.89,65.31 167.12,59.31 167.12,53.56 167.02,47.21 158.13,47.01 150.46,47.01 142.38,46.81 134.7,46.95 128.17,46.89 119.82,47.03 119.62,41.75 119.54,34.41 113.61,46.97 104.66,47.25 99.28,47.01 81.7,46.71 90.01,46.95 81.52,41.89 81.56,37.72 81.56,33.18 81.48,28.32 77.51,28.14 74.41,28.1 32.03,28.06 32.03,46.79 31.93,42.9 32.11,39.89 31.85,30.86 34.63,28.02 35.76,113.27 31.49,113.23 27.56,112.99 23.71,112.89 20.56,112.85 13.55,113.17 12.68,116.74 12.72,120.03 29.31,81 26.53,81.04 19.72,81.04 12.5,81.2 8.75,80.94 4.48,81 0.18,81.3 0.46,86.54 0.69,91.06 0.77,95.81 0.85,100.17 0.77,104.83 0.85,109.87 0.85,114.04 5.02,114.12 13.91,134.68 13.77,138.85 13.93,144.5 19.43,144.82 24.29,144.78 29.98,144.72 36.83,144.76 51.44,144.74 57.75,145.02 64.23,144.94 71.36,144.98 77.07,144.66 83.64,144.86 89.59,144.82 94.97,144.76 100.33,144.68 106.24,144.76 112.14,144.9 118.94,144.9 124.72,144.74 130.43,144.82 136.8,144.86 143.53,144.76 150.16,144.76 156.23,144.92 162.62,144.78 168.47,145.02 178.49,145.08 187.84,145.02 195.8,145.16 203.68,144.56 204.21,132.34 204.33,125.73 204.19,120.65 204.19,115.97 81.14,0.58 99.44,0.32 106.22,0.32 113.68,0.32 121.8,0.32 129.36,0.26 204.15,110.57 204.15,105.87 204.15,99.87 204.17,93.76 204.21,87.67 204.11,82.19 204.21,77.07 204.19,72.23 204.15,67.45 204.29,54.05 204.09,44.99 204.01,38.38 204.05,32.58 204.21,24.11 204.21,15.22 204.07,8.25 203.91,0.77 197.21,0.4 189.92,0.18 182.4,0.08 174.8,0.18 167.52,0.22 159.96,0.22 140.35,0.28 134.74,0.18 6.83,57.33 0.48,57.23 0.24,63.32 0.12,69.23 0.26,75.8 85.72,78.01
  pour Bottom (isolate 0.813): 0,144.78 204.47,144.78 204.47,0 0,0
  pour Top (isolate 0.813): 0,144.78 204.47,144.78 204.47,0 0,0
IF-TX
  Top 1.016: R61.1 100.89,59.47 R60.1 99.02,61.25 99.02,63.57 | C36.1 97.09,63.6 | 97.09,63.6 97.09,64.91 R59.2 | Q19.1 99.02,63.57 | 99.02,63.57 97.12,63.57 97.09,63.6
N$1
  Top 1.016: 100NF.1 139.02,18.16 | 139.02,18.16 139.02,16.77 R3.2 | Q1.2 142.06,18.16 139.02,18.16
N$2  (via drill 1.5)
  Top 1.016: L1.1 50.1,69.39 | 50.1,69.39 Q9.3 | C35.2 55.17,68 54.22,68.95 | 54.22,68.95 v53.54,69.63 50.35,69.63 50.1,69.39 | R45.2 56.9,68.95 54.22,68.95
  Bottom 1.016: v53.54,69.63 54.82,70.91 C23.-
N$3  (via drill 1.5)
  Top 1.016: v38.97,42.47 41.91,42.47 R5.1 42.03,39.62 C14.1
  Bottom 1.016: v38.97,42.47 38.97,38.5 SL3.2
N$4
  Top 1.016: 49.17,46.28 R6.2 45.86,45.54 R19.2 | 49.17,46.28 R7.1 | C17.1 51.92,46.28 49.17,46.28
N$5
  Top 1.016: Q6.3 49.17,41.71 | 49.17,41.71 R6.1 | C18.1 49.57,41.31 49.17,41.71
N$6
  Top 1.016: Q1.3 143.21,14.86 | 143.21,14.86 143.21,13.13 R1.1 | C11.+ 142.25,14.86 143.21,14.86
N$7  (via drill 1.5)
  Top 1.016: v133.37,12.32 136.11,12.32 C11.-
  Bottom 1.016: VOL.1 129.56,12.32 v133.37,12.32
N$8
  Bottom 1.016: VOL.2 127.85,16.57 121.68,16.57 IC5.3
N$9  (via drill 1.5)
  Top 1.016: R29.2 64.57,105.93 v64.57,106.4
  Bottom 1.016: v64.57,106.4 66.1,104.87 R28.E
N$10  (via drill 1.5)
  Top 1.016: C15.+ 105.52,20.76 R37.2 111.98,20.76 v113.27,22.05
  Bottom 1.016: v113.27,22.05 114,21.31 IC5.5
N$11  (via drill 1.5)
  Top 1.016: 101.4,21.28 C15.- 101.12,20.08 v101.12,19.01
  Bottom 1.016: v101.12,19.01 97.93,19.01 SPEAKER.2
N$12  (via drill 1.5)
  Top 1.016: C59.+ 109.55,12.9 v109.88,12.9
  Bottom 1.016: v109.88,12.9 111.06,14.09 111.94,14.09 IC5.7
N$13
  Top 1.016: C63.1 R37.1
N$14  (via drill 1.5)
  Top 1.016: C60.+ 122.95,8.43 v123.19,8.79
  Bottom 1.016: v123.19,8.79 122.91,10.26 IC5.1
N$15  (via drill 1.5)
  Top 1.016: v112.75,8.39 114.17,7.36 C60.-
  Bottom 1.016: IC5.8 112.55,10.1 v112.75,8.39
N$16
  Top 1.016: C14.2 45.36,38.83 R19.1 | C14.2 45.09,35.74 R18.2 | C14.2 48.05,38.56 Q6.1
N$17
  Top 1.016: R14.2 68.35,35.9 Q2.2 67.61,36.61 R12.2 69.12,33.45 C20.1
N$18
  Top 1.016: R21.2 50.52,35.7 | 50.52,35.7 51.45,35.7 C28.1 | Q6.2 50.52,38.33 50.52,35.7
N$19
  Top 1.016: Q2.1 62.8,36.62 | 62.8,36.62 C19.2 62.91,36.78 R10.1 | R9.2 62.79,36.61 62.8,36.62
N$20
  Top 1.016: R13.1 66.67,40.02 | 66.67,40.02 Q2.3 | Q3.1 66.74,39.96 66.67,40.02
N$21  (via drill 1.5)
  Top 1.016: R14.1 74.14,34.49 C24.2 72.23,32.92 C20.2 | Q3.2 72.72,39.82 R14.1 | v75.07,36.51 74.45,35.9 R14.1 | L30.2 36.33,52.46 v36.33,48.6
  Bottom 1.016: v75.07,36.51 74.73,36.51 68.86,30.64 40.14,30.64 35.46,35.32 35.46,47.72 v36.33,48.6
N$22  (via drill 1.5)
  Top 1.016: R10.2 62.91,43.36 v62.88,43.38
  Bottom 1.016: v62.88,43.38 61.62,44.65 61.62,48.14 R52.A
N$23
  Top 1.016: C33.1 44.27,64.71 R46.2
N$24
  Top 1.016: C35.1 57.26,66.39 Q15.1
N$25
  Top 1.016: R11.2 13.34,63.32 C25.2 | C25.2 15.8,63.32 C27.1 | Q5.1 13.92,65.83 R8.1 13.91,63.96 C25.2
N$26  (via drill 1.5)
  Top 1.016: C19.1 59.93,35.81 v59.93,35.12
  Bottom 1.016: v59.93,35.12 59.23,35.82 R15.S
N$27  (via drill 1.5)
  Top 1.016: C18.2 56.83,41.31 v56.89,41.25
  Bottom 1.016: v56.89,41.25 56.89,39.63 R15.E
N$28
  Top 1.016: Q8.1 32.28,65.68 C32.2 31.61,65.01 R22.2
N$29
  Top 1.016: C76.2 148.06,124.5 L23.1
N$30
  Top 1.016: R16.2 18.95,60.8 | 18.95,60.8 20.4,60.8 C30.1 | C31.1 19.29,63.16 | 19.29,63.16 18.43,63.16 | 18.43,63.16 17.7,63.16 C27.2 | 18.95,60.8 18.95,62.82 19.29,63.16 | Q5.2 18.33,63.26 18.43,63.16
N$31
  Top 1.016: C25.1 11.37,63.67 Q4.2
N$32
  Top 1.016: C31.2 22.62,63.26 | 22.62,63.26 R17.1 | Q7.1 22.77,63.11 22.62,63.26
N$33  (via drill 1.5)
  Top 1.016: R26.1 v83.32,107.38 83.23,108.15 R27.1
  Bottom 1.016: U$2.1 83.2,107.53 v83.32,107.38
N$34
  Top 1.016: L24.2 150.28,121.51 | 150.28,121.51 C77.1 | C76.1 150.16,121.39 150.28,121.51
N$35  (via drill 1.5)
  Top 1.016: v73.96,101.24 73,100.29 C39.1 72.77,99.44 C40.1 70.32,97.02 68.31,95 L2.1
  Bottom 1.016: U$2.3 76.24,103.53 v73.96,101.24
N$36
  Top 1.016: L24.1 156.29,129.79 | 156.29,129.79 157.23,129.79 C79.1 | C78.1 156.19,129.69 156.29,129.79
N$37  (via drill 1.5)
  Top 1.016: C100.1 138.85,53.94 v138.51,53.6
  Bottom 1.016: Z2.8 123.86,56.67 135.43,56.67 v138.51,53.6
N$38
  Top 1.016: U$10.CLK2 119.71,85.38 C21.1
N$39
  Top 1.016: U$10.CLK0 C22.1
N$40  (via drill 1.5)
  Top 1.016: C82.1 147.54,103.65 Q13.3 144.88,100.24 L15.1 142.26,98.91 v141.86,99.3
  Bottom 1.016: v141.86,99.3 140.11,97.54 C84.+
N$41
  Top 1.016: Q7.3 26.23,66.22 | 26.23,66.22 26.23,67.67 R20.1 | C32.1 28.7,66.22 26.23,66.22
N$42
  Top 1.016: C94.1 186.05,70.41 R69.2 | R70.1 C94.1 | C94.1 185.9,68.19 Q27.1
N$43
  Top 1.016: C33.2 38.85,64.71 | 38.85,64.71 37.49,64.71 Q8.3 | L30.1 38.85,62.14 38.85,64.71
N$44
  Top 1.016: R23.2 46.22,62.31 47.39,62.31 | 47.39,62.31 R47.2 | Q9.1 48.89,64.61 47.45,64.61 | 47.45,64.61 R46.1 46.31,64.65 R24.1 | 47.39,62.31 47.39,64.55 47.45,64.61
N$45
  Top 1.016: Q9.2 52.01,63.92 R25.2 C34.2
N$46  (via drill 1.5)
  Top 1.016: 18.83,128.05 22.46,128.05 D1.A 23,127.71 v23,130.59 | 18.83,128.05 Q12.3 | C53.2 18.83,125.21 18.83,128.05
  Bottom 1.016: v23,130.59 31.75,130.59 K1.2
N$47
  Top 1.016: C40.2 66.33,99.44 L3.1
N$48
  Top 1.016: Q18.2 94.59,62.7 C36.2 95.25,62.03 C37.1
N$50
  Top 1.016: C41.1 58.54,97.89 | 58.54,97.89 C42.1 | L3.2 58.54,102.99 58.54,97.89
N$51  (via drill 1.5)
  Top 1.016: C42.2 R32.1 53.99,99.5 v53.99,99.56
  Bottom 1.016: v53.99,99.56 53.32,100.23 R31.S
N$52
  Top 1.016: R33.2 51.02,95.32 R32.2 U$1.G
N$53
  Top 1.016: 40.52,96.49 L4.1 38.92,96.36 33.87,96.36 33.61,96.09 L5.2 | 40.52,96.49 43.27,96.49 43.8,97.02 U$1.D | C46.2 40.3,96.71 40.52,96.49
N$54
  Top 1.016: R35.2 12.95,129 Q12.1
N$55  (via drill 1.5)
  Top 1.016: R34.1 48.48,108.39 v48.36,108.51
  Bottom 1.016: v48.36,108.51 50.78,106.08 R31.E
N$57  (via drill 1.5)
  Top 1.016: C54.2 57.43,129.4 v56.52,130.31
  Bottom 1.016: K1.O 45.26,129.28 47.66,131.68 51.59,131.68 v56.52,130.31
N$58
  Top 1.016: L5.1 26.22,96.82 27.5,96.82 28.26,97.57 28.26,99.28 C47.2
N$59
  Top 1.016: L6.2 24.25,101.94 C48.2 27.16,102.28 C47.1
N$60
  Top 1.016: C49.2 16.93,93.15 18.97,93.15 | 18.97,93.15 18.97,94.82 L7.2 | L6.1 18.97,92.8 18.97,93.15
N$61
  Top 1.016: L8.2 9.09,95.3 | 9.09,95.3 9.81,95.3 11.04,96.53 L7.1 | C50.2 9.05,95.26 9.09,95.3
N$62
  Top 1.016: C52.2 9.25,105.79 | 9.25,105.79 C51.2 | L8.1 9.25,103.37 9.25,105.79
N$63
  Top 1.016: 146.72,94.04 148.07,94.04 C85.1 152.23,93.82 R53.2 | 146.72,94.04 R54.1 | Q13.1 146.59,94.18 146.72,94.04
N$64  (via drill 1.5)
  Top 1.016: v60.34,124.24 60.31,124.27 60.5,124.45 L19.2 62.55,125.46 C56.2 62.53,127.71 C54.1
  Bottom 1.016: C55.- 60.31,124.27 v60.34,124.24
N$65  (via drill 1.5)
  Top 1.016: C56.1 67.47,127.73 C58.2 v67.65,130.81 67.65,133.78 L9.2
  Bottom 1.016: C57.- 66.09,130.81 v67.65,130.81
N$66
  Top 1.016: 69.77,127.33 R36.2 69.87,124.7 T1.B | 69.77,127.33 C58.1 | R38.1 71.35,127.33 69.77,127.33
N$67
  Top 1.016: R39.2 75.84,118.86 | 75.84,118.86 77.05,118.86 C62.2 | 75.84,118.86 75.84,121.21 T1.E
N$68  (via drill 1.5)
  Top 1.016: T1.C 76.16,128.61 | 76.16,128.61 76.16,130.61 75.93,130.84 L10.1 | 76.16,128.61 79.81,128.61 C65.2 80.07,128.35 v80.07,130.35
  Bottom 1.016: v80.07,130.35 82.14,132.43 C64.+
N$69
  Top 1.016: R41.1 88.42,129.88 C67.1 | R40.2 88.42,125.25 C67.1 | T2.B 90.23,127.61 C67.1
N$70
  Top 1.016: C65.1 82.71,127.61 84.75,127.61 | 84.75,127.61 C67.2 | 84.75,127.61 L11.2 84.75,122.32 C66.2
N$71
  Top 1.016: T2.E 95.89,119.1 C69.2 95.84,118.9 R42.2
N$72
  Top 1.016: C71.2 96.1,128.53 T2.C 95.89,130.51 95.48,130.92 L12.1 94.79,130.95 94.79,131.86 95.61,132.68 C70.2
N$73
  Top 1.016: C73.2 103.25,128.59 C71.1 101.25,128.36 L13.2 101.32,125.99 C72.2
N$74  (via drill 1.5)
  Top 1.016: C85.2 148.29,89.79 C86.1 149.84,88.36 154.75,88.36 L16.2 155.11,88.28 v157.1,88.28
  Bottom 1.016: v157.1,88.28 157.1,91.61 C88.-
N$75
  Top 1.016: C80.1 147.56,108.13 C82.2 147.56,106.7 147.68,106.82 151.46,106.82 L14.2 153.23,107.09 C87.1
N$76
  Top 1.016: R51.2 152.54,99.85 152.54,98.27 | 152.54,98.27 C81.1 | Q13.2 152.31,98.04 152.54,98.27
N$77
  Top 1.016: Q27.2 185.75,63.9 C119.2 183.49,66.54 R71.1
N$78  (via drill 1.5)
  Top 1.016: C86.2 149.78,82.95 | 149.78,82.95 Q14.3 | 149.78,82.95 148.78,81.96 L17.1 144.7,82.9 v144.7,85.43
  Bottom 1.016: C92.+ 144.7,88.02 v144.7,85.43
N$79
  Top 1.016: 141.41,76.93 141.54,77.07 R56.2 149.16,77.08 Q14.1 | 141.41,76.93 141.45,76.89 C93.1 | 141.41,76.93 141.35,76.99 R57.1
N$80
  Top 1.016: C95.2 141.65,73.3 C93.2
N$81
  Top 1.016: Q28.1 181.53,62.08 181.53,63.83 C119.1
N$82
  Top 1.016: Q14.2 156.4,79.08 158.39,79.08 | 158.39,79.08 159.15,79.83 R55.2 | C89.1 158.39,77.39 158.39,79.08
N$83  (via drill 1.5)
  Top 1.016: C97.2 141.74,66.81 | 141.74,66.81 141.74,68.2 C95.1 | 141.74,66.81 144.79,66.81 L18.2 146.19,69.97 v146.19,71.75
  Bottom 1.016: v146.19,71.75 146.29,71.66 C96.-
N$84  (via drill 1.5)
  Top 1.016: L20.2 146.28,60.32 v145.53,61.06 142.22,61.06 C99.2 141.74,60.82 C97.1
  Bottom 1.016: v145.53,61.06 147.53,61.06 C98.-
N$85
  Top 1.016: C100.2 141.56,58.5 C99.1
N$86  (via drill 1.5)
  Top 1.016: Q19.3 103.06,67.77 L21.1 105.46,67.79 C101.1 107.97,69.85 v107.47,70.35
  Bottom 1.016: v107.47,70.35 105.31,72.8 C103.+
N$87
  Top 1.016: R58.1 106.54,62.98 | 106.54,62.98 106.54,64.2 C102.1 | Q19.2 102.6,62.98 106.54,62.98
N$88
  Top 2.54: 33.02,113.03 21.59,113.03
N$89
  Top 1.016: R74.1 178.78,55.34 179.78,56.35 Q28.3
N$90
  Top 1.016: C79.2 161.07,129.56 | 161.07,129.56 162.71,129.56 Q20.1 | R50.1 160.97,129.46 161.07,129.56 | R49.2 161.37,129.86 161.07,129.56
N$91
  Top 1.016: C107.2 167.12,124.66 | 167.12,124.66 168.55,124.66 R62.1 | Q20.2 167.12,127.05 167.12,124.66
N$92  (via drill 1.5)
  Top 1.016: Q20.3 167.92,130.8 L25.2 168.92,129.8 C108.1 175.1,130.5 v175.1,130.77 | R48.2 v183.06,134.56
  Bottom 1.016: v175.1,130.77 175.1,131.91 C105.- 177.75,134.56 v183.06,134.56
N$93
  Top 1.016: R67.2 191.89,66.44 | 191.89,66.44 191,66.44 | 191,66.44 189.54,66.44 Q27.3 | R69.1 191,70.05 191,66.44 | Q29.1 191.74,66.29 191.89,66.44
N$94
  Top 1.016: Q21.2 189.2,125.59 189.14,125.53 | 189.14,125.53 C110.1 | Q23.1 189.14,125.53
N$95
  Top 1.016: Q23.2 184.32,115.71 | 184.32,115.71 Q24.1 | C109.1 184.47,115.55 184.32,115.71
N$96
  Top 1.016: Q24.2 189.14,106.82 | 189.14,106.82 189.14,102.04 Q25.1 | C111.1 189.06,106.9 189.14,106.82
N$97
  Top 1.016: C108.2 183.58,129.8 Q21.1
N$98
  Top 1.016: C112.1 183.97,94.46 C113.2 183.84,94.59 R63.1
N$99
  Top 1.016: C113.1 183.91,101.63 Q25.2
N$100
  Top 1.016: R65.1 183.93,89.97 C112.2 184.11,89.79 | R64.2 184.11,89.79 | Q26.1 183.96,89.64 184.11,89.79
N$101
  Top 1.016: C117.2 180.99,81.42 R66.1 183.72,84.12 Q26.2
N$102  (via drill 1.5)
  Top 1.016: C116.1 186.12,80.98 | 186.12,80.98 v186.07,81.02 | 186.12,80.98 186.16,81.03 Q26.3 188.87,85.31 L26.2
  Bottom 1.016: v186.07,81.02 187.73,81.02 C115.-
N$103
  Top 1.016: Q30.3 197.07,58.53 C90.2 197.07,61.28 | 197.07,61.28 R68.2 196.93,62.81 196.93,65.6 196.1,66.44 R67.1 | Q29.3 196.99,61.36 197.07,61.28
N$104
  Top 1.016: R72.1 191.56,60.23 | 191.56,60.23 Q29.2 | Q30.1 191.56,57.69 191.56,60.23
N$105  (via drill 1.5)
  Top 1.016: C101.2 110.09,67.57 v114.04,67.57
  Bottom 1.016: Z2.4 Z2.3 117.93,67.57 v114.04,67.57
N$106
  Top 1.016: Q30.2 186.47,55.03 R73.1 185.64,54.2 C120.2
N$107  (via drill 1.5)
  Top 1.016: L22.2 141.28,130.47 L23.2 141.82,128.16 141.82,127.5 | C13.1 141.82,127.5 | v134.2,127.06 141.39,127.06 141.82,127.5
  Bottom 1.016: v134.2,127.06 133.25,126.11 Z1.3 126.88,126.11 Z1.4
N$108
  Top 1.016: Q31.1 190.51,47.55 R77.2 190.9,49.31 | 190.9,49.31 190.9,50.42 R78.1 | C120.1 187.82,49.31 190.9,49.31
N$109
  Top 1.016: Q31.2 187.5,42.59 C127.2 187.38,42.86 R79.1
N$110
  Top 1.016: Q32.1 180.07,44.88 182.17,42.78 C127.1
N$111
  Top 2.54: 12.6,119.48 12.7,113.03 13.97,113.03
N$112
  Top 1.016: Q32.3 177.32,48.77 R82.1
N$113
  Top 1.016: Q33.1 195.94,41.28 195.94,43.54 | 195.94,43.54 R75.2 | Q31.3 194.77,43.54 | 194.77,43.54 195.94,43.54 | R77.1 193.46,47.94 194.77,46.63 194.77,43.54
N$114
  Top 1.016: 198.91,39.56 Q33.3 | Q34.3 198.91,35.88 198.91,39.56 | 198.91,39.56 198.91,43.26 R75.1 198.04,44.53 R76.2 198.04,50.38 C122.2
N$115
  Top 1.016: 2.2K.1 195.14,39.13 | 195.14,39.13 196.19,39.13 Q33.2 | Q34.1 195.14,37.08 195.14,39.13
N$116
  Top 1.016: C131.2 195.9,34.27 | 195.9,34.27 Q34.2 | R81.1 195.9,34.27
N$117
  Top 1.016: Q35.1 192.53,23.7 R85.2 193,27.17 R86.1 195.58,27.39 C131.1
N$118
  Top 1.016: R87.1 186.97,27.37 | 186.97,27.37 C132.2 | Q35.2 186.97,24.34 186.97,27.37
N$119
  Top 1.016: Q36.1 184.35,26.91 C132.1
N$121
  Top 1.016: Q36.3 178.38,28.84 R90.1
N$122
  Top 1.016: Q37.1 184.71,18.15 R83.2 Q35.3 188.72,21.33 R85.1
N$123
  Top 1.016: C130.2 192.48,16.25 190.72,16.25 | 190.72,16.25 R83.1 188.63,16.17 | 188.63,16.17 188.33,15.87 Q37.3 183.5,15.69 Q38.3 178.97,15.03 R84.2 | 188.63,16.17 190.64,16.17 190.72,16.25
N$124
  Top 1.016: Q37.2 182.54,17.89 181.41,17.89 | 181.41,17.89 Q38.1 | R88.1 181.41,20.06 181.41,17.89
N$125  (via drill 1.5)
  Top 1.016: R89.1 177.37,21.24 Q38.2 174.23,17.89 C133.2 174.07,15.26 v172.48,13.67 | v123.94,32.8 126.48,32.8 C144.1
  Bottom 1.016: v172.48,13.67 153.35,32.8 v123.94,32.8
N$126
  Top 1.016: Q42.3 177.16,35.96 | 177.16,35.96 178.46,35.96 | 178.46,35.96 R105.2 181.87,35.96 R106.2 | R90.2 178.38,35.88 178.46,35.96 | 177.16,35.96 177.16,41.42 173.63,44.94 R82.2 173.63,54.81 R74.2
N$128
  Top 1.016: C136.2 166.35,14.44 | 166.35,14.44 R92.1 | 166.35,14.44 166.32,14.47 Q39.2 163.84,17.09 C128.1
N$129
  Top 1.016: Q39.3 171.85,18.04 C133.1 172.15,17.74 R91.1
N$130
  Top 1.016: 165.81,21.89 C126.2 168.34,21.69 R93.2 | 165.81,21.89 C135.1 | Q39.1 166.32,21.37 165.81,21.89
N$132  (via drill 1.5)
  Top 1.016: C144.2 v127.69,29.69
  Bottom 1.016: v127.69,29.69 125.06,27.05 R94.E
N$134
  Top 2.54: 37.56,80.9 37.56,81.24 49.45,81.24
N$135
  Top 1.016: Q42.1 171.98,36.71 R103.1
N$137
  Top 1.016: D3.C 166.55,36.39 | 166.55,36.39 169.77,36.39 | 169.77,36.39 R103.2 | R102.2 170.02,36.14 169.77,36.39 | C141.1 166.59,36.35 166.55,36.39
N$138
  Top 1.016: D3.A 154.31,35.56 152.4,35.56 | 152.4,35.56 C140.1 | D2.C 152.4,30.6 152.4,35.56
N$139
  Top 1.016: 145.79,35.56 R100.1 145.25,35.06 R99.2 | 145.79,35.56 C140.2 | Q41.3 145.69,35.46 145.79,35.56
N$140
  Top 1.016: Q41.1 144.69,29.75 C139.1 141.9,32.77 R99.1
N$141
  Top 1.016: Q15.2 66.13,62.77 | 66.13,62.77 66.42,62.48 | 66.61,62.29 66.42,62.48 | 66.42,62.48 C124.1 | Q16.1 69.69,62.77 66.13,62.77
N$142
  Top 1.016: Q40.3 136.68,28.48 136.68,29.77 | 136.68,29.77 R97.2 136.58,31.83 R95.1 | C139.2 136.7,29.75 136.68,29.77
N$143  (via drill 1.5)
  Top 1.016: v130.06,24.19 130.06,26.43 C137.2
  Bottom 1.016: R94.S 129.76,24.49 v130.06,24.19
N$144
  Top 1.016: 133.81,25.93 132.98,25.93 C137.1 132.1,26.81 R95.2 | 133.81,25.93 Q40.1 | R96.1 133.81,23.55 133.81,25.93
N$145
  Top 1.016: Q40.2 137.75,25.46 R98.1 142.42,25.99 C138.2
N$146
  Top 1.016: Q16.2 75.25,66.79 | 75.25,66.79 78.54,66.79 Q17.1 | C123.1 74.83,66.37 75.25,66.79
N$147
  Top 1.016: Q18.1 84.17,60.61 | 84.17,60.61 C125.1 | Q17.2 83.77,61.01 84.17,60.61
N$149  (via drill 1.5)
  Top 1.016: R105.1 179.69,40.06 v179.84,40.22 | v138.83,41 138.83,37.53 R101.1 | R100.2 145.77,40.94 v145.71,41
  Bottom 1.016: v179.84,40.22 179.07,41 v145.71,41 v138.83,41
N$161  (via drill 1.5)
  Top 1.016: D8.A 55.5,17.62 | 55.5,17.62 55.5,19.66 Q22.3 | 55.5,17.62 55.09,18.04 v53.04,18.04
  Bottom 1.016: v53.04,18.04 61.29,18.04 K2.2
N$162
  Top 1.016: R115.2 56.51,24.67 Q22.1
OSC1  (via drill 1.5)
  Top 1.016: v123.21,116.72 123.21,106.34 C22.2
  Bottom 1.016: Z1.1 123.49,116.72 v123.21,116.72
OSC2  (via drill 1.5)
  Top 1.016: C21.2 123.05,83.2 v122.69,82.85
  Bottom 1.016: v122.69,82.85 118.31,78.46 Z2.1
POWER-SWT  (via drill 1.5)
  Top 1.016: v36,22.15 R30.1 43.93,23.14 45.78,24.98 R115.1
  Bottom 1.016: v36,22.15 PTT.1 20.24,17.28 14.59,22.94 10.94,26.58 SV3.2
RF-AMP-IN  (via drill 1.5)
  Top 1.016: R26.2 69.87,108.47 v69.99,108.37 | C80.2 149.58,110.17 v149.66,110.25
  Bottom 1.016: R28.S 69.71,104.93 v69.99,108.37 72.19,110.57 149.34,110.57 v149.66,110.25
RX-IF
  Top 1.016: C94.2 186.12,74.51 C116.2
RX-OUT  (via drill 1.5)
  Top 1.016: C73.1 107.3,128.43 v107.55,128.69
  Bottom 1.016: v107.55,128.69 115.13,136.27 Z1.8
S-METER(MCU-ADC)  (via drill 1.5)
  Top 1.016: R104.2 174.75,32.55 Q42.2 173.76,33.81 v173.61,33.81
  Bottom 1.016: v173.61,33.81 182.36,25.06 182.36,10.99 174.53,3.15 22.27,3.15 5.74,19.68 SV3.1
SCL  (via drill 1.5)
  Top 1.016: v90.03,97.17 94.58,97.17 R44.2
  Bottom 1.016: SV3.6 13.66,42.43 27.03,55.8 90.81,55.8 94.95,59.95 94.95,71.34 88.27,78.03 88.27,95.41 89.15,96.29 | v90.03,97.17 89.15,96.29 | U$10.SCL 99.45,96.29 89.15,96.29
SDA  (via drill 1.5)
  Top 1.016: R43.2 92.95,85.17 v92.97,85.15
  Bottom 1.016: SV3.5 17.75,38.47 31.28,52 93.99,52 97.71,55.72 97.71,75.19 91.04,81.85 91.04,84.89 | v92.97,85.15 91.3,85.15 91.04,84.89 | U$10.SDA 91.39,93.23 91.04,92.89 91.04,84.89
TX-RF  (via drill 1.5)
  Top 1.016: C51.1 v11.86,107.55 v11.87,107.55
  Bottom 1.016: K1.S 35.27,107.55 v11.87,107.55
V-REF+7V  (via drill 1.5)
  Top 1.016: Q36.2 181.61,28.86 C134.2 181.83,30.6 186.41,30.6 v188.4,32.58 | C121.2 177.19,61.29 Q28.2 | C121.2 176.61,65.71 R107.2 | R107.2 174.31,65.76 R108.1 | R107.2 176.55,68.63 C142.1 176.4,71.47 C143.1 | Q32.2 180.47,50.46 C129.2 181.05,50.29 v182.54,49.03 | C121.2 177.19,60.12 v177.19,59.35
  Bottom 1.016: v188.4,32.58 188.4,48.14 187.5,49.03 | v177.19,59.35 187.5,49.03 | 187.5,49.03 v182.54,49.03